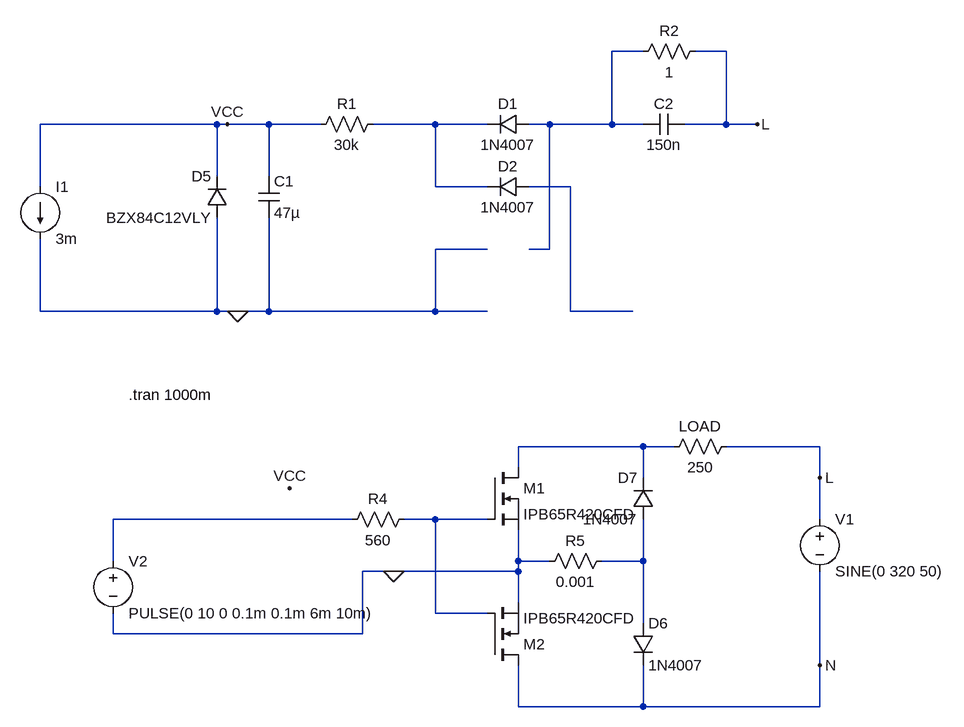
[diagram p0: schematic dimmer_test.asc]
dimmer_test.asc, the LTspice schematic file:
Version 4.1
SHEET 1 880 680
WIRE -208 -592 -256 -592
WIRE -80 -592 -128 -592
WIRE -864 -480 -1136 -480
WIRE -848 -480 -864 -480
WIRE -784 -480 -848 -480
WIRE -704 -480 -784 -480
WIRE -528 -480 -624 -480
WIRE -448 -480 -528 -480
WIRE -352 -480 -384 -480
WIRE -256 -480 -256 -592
WIRE -256 -480 -352 -480
WIRE -208 -480 -256 -480
WIRE -80 -480 -80 -592
WIRE -80 -480 -144 -480
WIRE -32 -480 -80 -480
WIRE -864 -400 -864 -480
WIRE -784 -400 -784 -480
WIRE -1136 -384 -1136 -480
WIRE -528 -384 -528 -480
WIRE -448 -384 -528 -384
WIRE -320 -384 -384 -384
WIRE -448 -288 -528 -288
WIRE -352 -288 -352 -480
WIRE -352 -288 -384 -288
WIRE -1136 -192 -1136 -304
WIRE -864 -192 -864 -336
WIRE -864 -192 -1136 -192
WIRE -832 -192 -864 -192
WIRE -784 -192 -784 -336
WIRE -784 -192 -832 -192
WIRE -528 -192 -528 -288
WIRE -528 -192 -784 -192
WIRE -448 -192 -528 -192
WIRE -320 -192 -320 -384
WIRE -224 -192 -320 -192
WIRE -208 16 -400 16
WIRE -160 16 -208 16
WIRE 64 16 -80 16
WIRE -400 48 -400 16
WIRE -208 64 -208 16
WIRE 64 64 64 16
WIRE -656 128 -1024 128
WIRE -528 128 -576 128
WIRE -448 128 -528 128
WIRE 64 128 64 64
WIRE -1024 192 -1024 128
WIRE -400 192 -400 144
WIRE -352 192 -400 192
WIRE -208 192 -208 128
WIRE -208 192 -272 192
WIRE -592 208 -640 208
WIRE -400 208 -400 192
WIRE -400 208 -592 208
WIRE -400 256 -400 208
WIRE -528 272 -528 128
WIRE -448 272 -528 272
WIRE -208 288 -208 192
WIRE -1024 304 -1024 272
WIRE -640 304 -640 208
WIRE -640 304 -1024 304
WIRE 64 352 64 208
WIRE -400 416 -400 352
WIRE -208 416 -208 352
WIRE -208 416 -400 416
WIRE 64 416 64 352
WIRE 64 416 -208 416
FLAG 64 352 N
FLAG 64 64 L
FLAG -32 -480 L
FLAG -848 -480 VCC
FLAG -752 80 VCC
FLAG -832 -192 0
FLAG -592 208 0
SYMBOL voltage 64 112 R0
WINDOW 123 0 0 Left 0
WINDOW 39 0 0 Left 0
SYMATTR InstName V1
SYMATTR Value SINE(0 320 50)
SYMBOL nmos -448 48 R0
SYMATTR InstName M1
SYMATTR Value IPB65R420CFD
SYMBOL nmos -448 352 M180
SYMATTR InstName M2
SYMATTR Value IPB65R420CFD
SYMBOL res -64 0 R90
WINDOW 0 0 56 VBottom 2
WINDOW 3 32 56 VTop 2
SYMATTR InstName LOAD
SYMATTR Value 250
SYMBOL diode -384 -496 R90
WINDOW 0 0 32 VBottom 2
WINDOW 3 32 32 VTop 2
SYMATTR InstName D1
SYMATTR Value 1N4007
SYMBOL diode -384 -400 R90
WINDOW 0 0 32 VBottom 2
WINDOW 3 32 32 VTop 2
SYMATTR InstName D2
SYMATTR Value 1N4007
SYMBOL res -608 -496 R90
WINDOW 0 0 56 VBottom 2
WINDOW 3 32 56 VTop 2
SYMATTR InstName R1
SYMATTR Value 30k
SYMBOL cap -800 -400 R0
SYMATTR InstName C1
SYMATTR Value 47µ
SYMBOL diode -848 -336 R180
WINDOW 0 24 64 Left 2
WINDOW 3 24 0 Left 2
SYMATTR InstName D5
SYMATTR Value BZX84C12VLY
SYMBOL cap -144 -496 R90
WINDOW 0 0 32 VBottom 2
WINDOW 3 32 32 VTop 2
SYMATTR InstName C2
SYMATTR Value 150n
SYMBOL res -112 -608 R90
WINDOW 0 0 56 VBottom 2
WINDOW 3 32 56 VTop 2
SYMATTR InstName R2
SYMATTR Value 1
SYMBOL res -560 112 R90
WINDOW 0 0 56 VBottom 2
WINDOW 3 32 56 VTop 2
SYMATTR InstName R4
SYMATTR Value 560
SYMBOL voltage -1024 176 R0
WINDOW 123 0 0 Left 0
WINDOW 39 0 0 Left 0
SYMATTR InstName V2
SYMATTR Value PULSE(0 10 0 0.1m 0.1m 6m 10m)
SYMBOL diode -224 288 R0
SYMATTR InstName D6
SYMATTR Value 1N4007
SYMBOL diode -192 128 R180
WINDOW 0 24 64 Left 2
WINDOW 3 24 0 Left 2
SYMATTR InstName D7
SYMATTR Value 1N4007
SYMBOL res -368 208 R270
WINDOW 0 32 56 VTop 2
WINDOW 3 0 56 VBottom 2
SYMATTR InstName R5
SYMATTR Value 0.001
SYMBOL current -1136 -384 R0
WINDOW 123 0 0 Left 0
WINDOW 39 0 0 Left 0
SYMATTR InstName I1
SYMATTR Value 3m
TEXT -1000 -64 Left 2 !.tran 1000m

The netlist it stands for:
* dimmer_test.asc
V1 L N SINE(0 320 50)
M1 N004 N006 0 0 IPB65R420CFD
M2 N N006 0 0 IPB65R420CFD
R§LOAD L N004 250
D1 N001 N002 1N4007
D2 N003 N002 1N4007
R1 N002 VCC 30k
C1 VCC 0 47µ
D5 0 VCC BZX84C12VLY
C2 L N001 150n
R2 L N001 1
R4 N006 N005 560
V2 N005 0 PULSE(0 10 0 0.1m 0.1m 6m 10m)
D6 N007 N 1N4007
D7 N007 N004 1N4007
R5 0 N007 0.001
I1 VCC 0 3m
.model D D
.lib standard.dio
.model NMOS NMOS
.model PMOS PMOS
.lib standard.mos
.tran 1000m
.backanno
.end